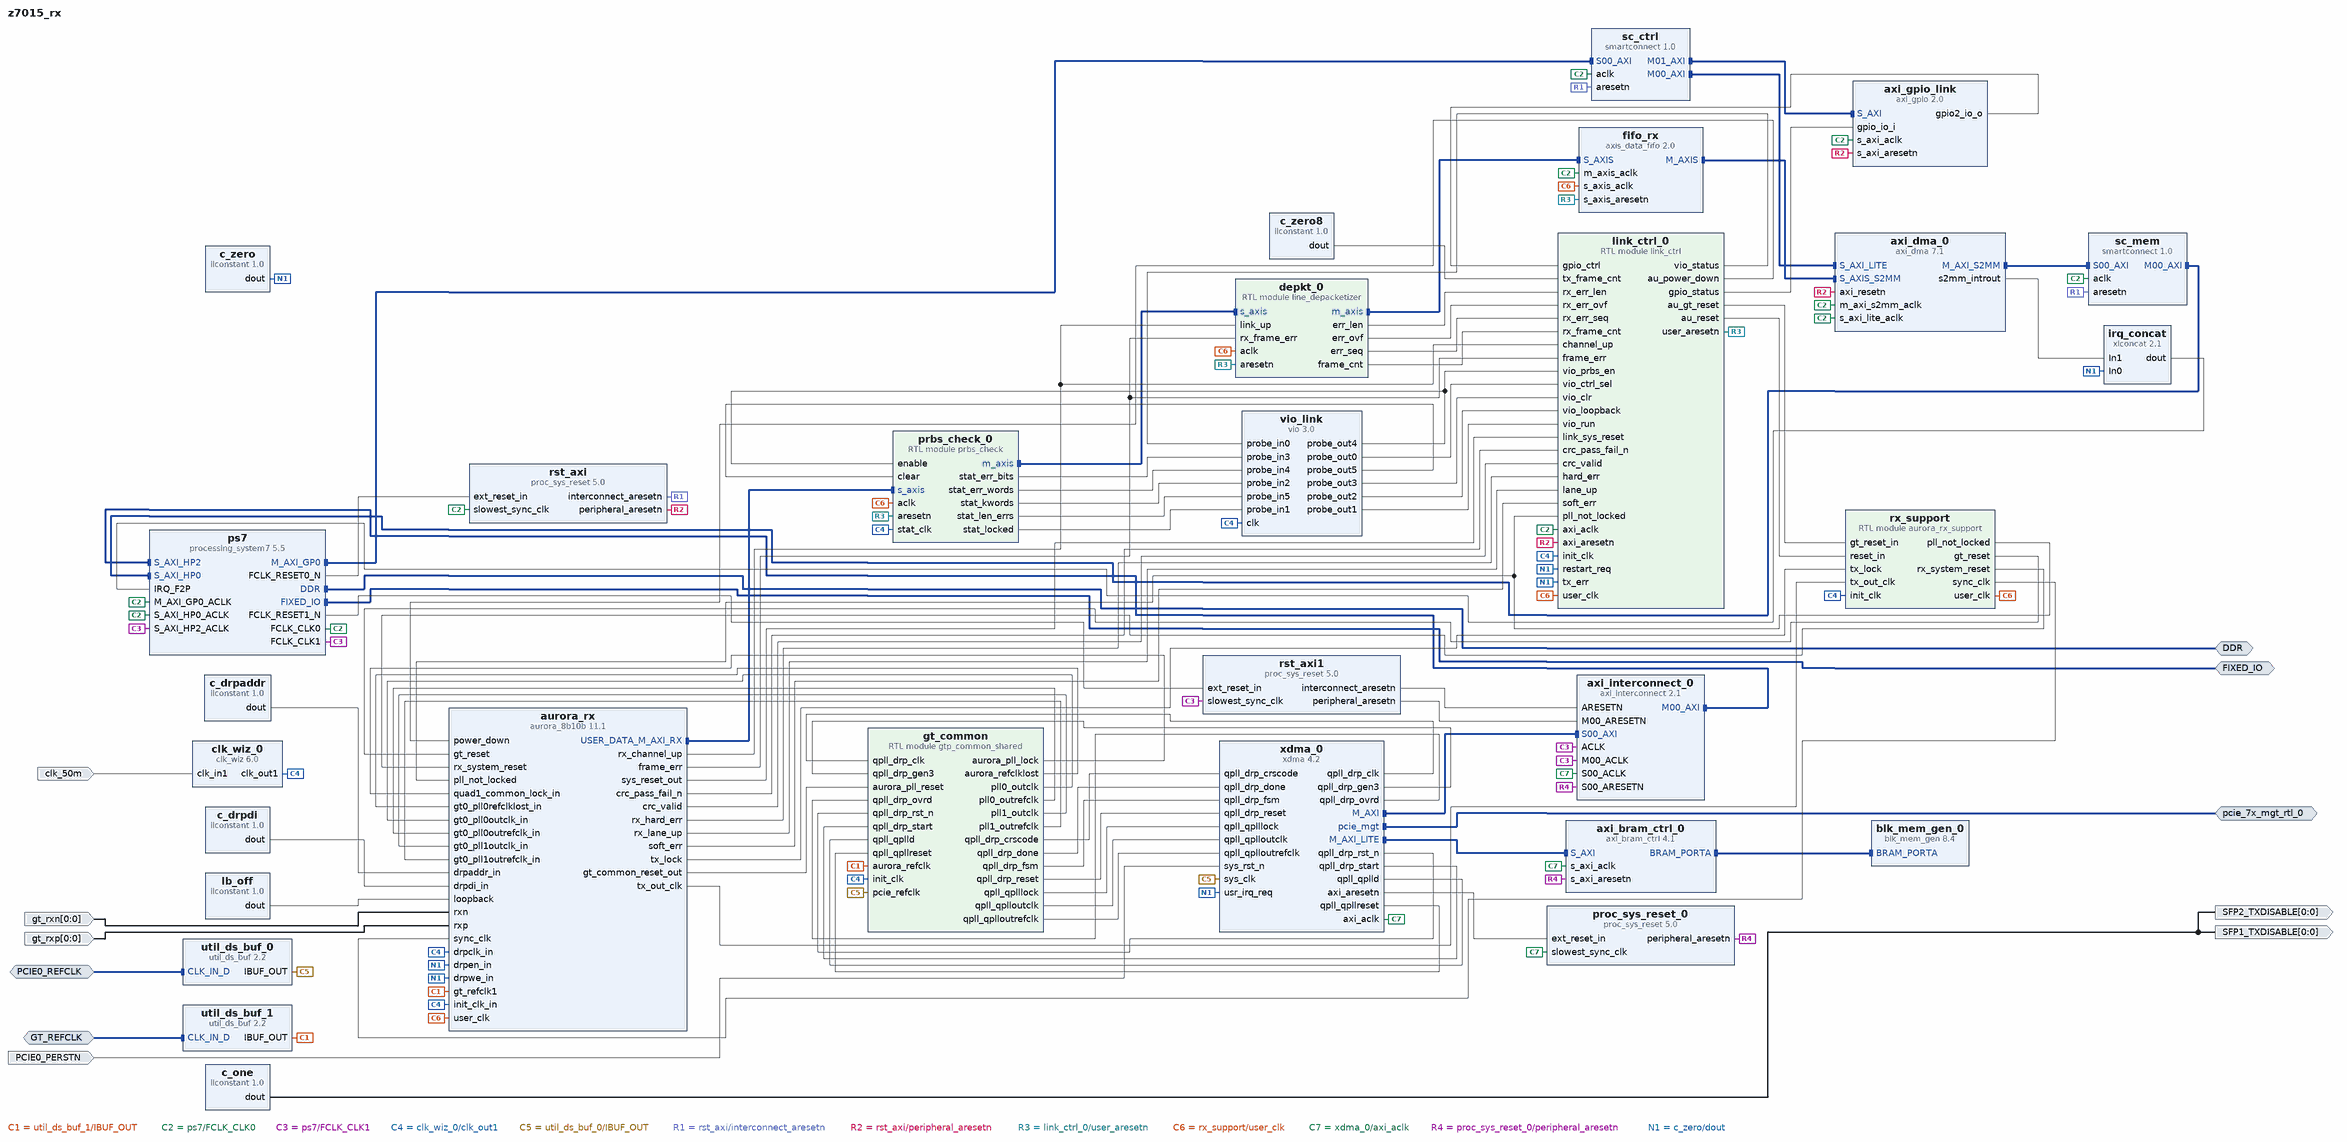
[diagram p0: block diagram of the top level]
# Vivado block design z7015_rx, xc7z015clg485-2, Vivado 2025.2
create_bd_design z7015_rx

create_bd_intf_port -mode Master -vlnv xilinx.com:interface:ddrx_rtl:1.0 DDR
create_bd_intf_port -mode Master -vlnv xilinx.com:display_processing_system7:fixedio_rtl:1.0 FIXED_IO
create_bd_intf_port -mode Slave -vlnv xilinx.com:interface:diff_clock_rtl:1.0 PCIE0_REFCLK
set_property -dict {CONFIG.FREQ_HZ 100000000} [get_bd_intf_ports PCIE0_REFCLK]
create_bd_intf_port -mode Slave -vlnv xilinx.com:interface:diff_clock_rtl:1.0 GT_REFCLK
set_property -dict {CONFIG.FREQ_HZ 125000000} [get_bd_intf_ports GT_REFCLK]
create_bd_intf_port -mode Master -vlnv xilinx.com:interface:pcie_7x_mgt_rtl:1.0 pcie_7x_mgt_rtl_0
create_bd_port -dir I -from 0 -to 0 gt_rxp
create_bd_port -dir I -from 0 -to 0 gt_rxn
create_bd_port -dir I -type clk clk_50m
set_property -dict {CONFIG.FREQ_HZ 50000000} [get_bd_ports clk_50m]
create_bd_port -dir O -from 0 -to 0 SFP1_TXDISABLE
create_bd_port -dir O -from 0 -to 0 SFP2_TXDISABLE
create_bd_port -dir I PCIE0_PERSTN

create_bd_cell -type ip -vlnv xilinx.com:ip:processing_system7:5.5 ps7
set_property -dict [list \
  CONFIG.PCW_APU_PERIPHERAL_FREQMHZ 766.666666 \
  CONFIG.PCW_CPU_CPU_6X4X_MAX_RANGE 767 \
  CONFIG.PCW_ENET0_ENET0_IO {MIO 16 .. 27} \
  CONFIG.PCW_ENET0_GRP_MDIO_ENABLE 1 \
  CONFIG.PCW_ENET0_GRP_MDIO_IO {MIO 52 .. 53} \
  CONFIG.PCW_ENET0_PERIPHERAL_ENABLE 1 \
  CONFIG.PCW_ENET0_RESET_ENABLE 1 \
  CONFIG.PCW_ENET0_RESET_IO {MIO 7} \
  CONFIG.PCW_ENET_RESET_ENABLE 1 \
  CONFIG.PCW_ENET_RESET_SELECT {Share reset pin} \
  CONFIG.PCW_EN_CLK1_PORT 1 \
  CONFIG.PCW_EN_RST1_PORT 1 \
  CONFIG.PCW_FCLK_CLK1_BUF TRUE \
  CONFIG.PCW_FPGA0_PERIPHERAL_FREQMHZ 100 \
  CONFIG.PCW_FPGA1_PERIPHERAL_FREQMHZ 140 \
  CONFIG.PCW_FPGA_FCLK1_ENABLE 1 \
  CONFIG.PCW_GPIO_MIO_GPIO_ENABLE 1 \
  CONFIG.PCW_GPIO_MIO_GPIO_IO MIO \
  CONFIG.PCW_I2C_RESET_ENABLE 0 \
  CONFIG.PCW_IRQ_F2P_INTR 1 \
  CONFIG.PCW_PERIPHERAL_BOARD_PRESET None \
  CONFIG.PCW_PRESET_BANK1_VOLTAGE {LVCMOS 1.8V} \
  CONFIG.PCW_QSPI_GRP_SINGLE_SS_ENABLE 1 \
  CONFIG.PCW_QSPI_GRP_SINGLE_SS_IO {MIO 1 .. 6} \
  CONFIG.PCW_QSPI_PERIPHERAL_ENABLE 1 \
  CONFIG.PCW_QSPI_QSPI_IO {MIO 1 .. 6} \
  CONFIG.PCW_SD0_GRP_CD_ENABLE 0 \
  CONFIG.PCW_SD0_GRP_WP_ENABLE 0 \
  CONFIG.PCW_SD0_PERIPHERAL_ENABLE 1 \
  CONFIG.PCW_SD0_SD0_IO {MIO 40 .. 45} \
  CONFIG.PCW_SDIO_PERIPHERAL_FREQMHZ 100 \
  CONFIG.PCW_SINGLE_QSPI_DATA_MODE x4 \
  CONFIG.PCW_UART0_PERIPHERAL_ENABLE 1 \
  CONFIG.PCW_UART0_UART0_IO {MIO 14 .. 15} \
  CONFIG.PCW_UART1_PERIPHERAL_ENABLE 0 \
  CONFIG.PCW_UART_PERIPHERAL_FREQMHZ 100 \
  CONFIG.PCW_UIPARAM_DDR_FREQ_MHZ 533.333333 \
  CONFIG.PCW_UIPARAM_DDR_MEMORY_TYPE {DDR 3 (Low Voltage)} \
  CONFIG.PCW_UIPARAM_DDR_PARTNO Custom \
  CONFIG.PCW_USB0_PERIPHERAL_ENABLE 1 \
  CONFIG.PCW_USB0_RESET_ENABLE 1 \
  CONFIG.PCW_USB0_RESET_IO {MIO 8} \
  CONFIG.PCW_USB0_USB0_IO {MIO 28 .. 39} \
  CONFIG.PCW_USB_RESET_ENABLE 1 \
  CONFIG.PCW_USB_RESET_SELECT {Share reset pin} \
  CONFIG.PCW_USE_FABRIC_INTERRUPT 1 \
  CONFIG.PCW_USE_S_AXI_HP0 1 \
  CONFIG.PCW_USE_S_AXI_HP2 1 \
] [get_bd_cells ps7]
# 521 more settings of ps7 are not shown: defaults, MIO pin electricals, DDR timing, and values the tool derives
create_bd_cell -type ip -vlnv xilinx.com:ip:proc_sys_reset:5.0 rst_axi
create_bd_cell -type ip -vlnv xilinx.com:ip:proc_sys_reset:5.0 rst_axi1
create_bd_cell -type ip -vlnv xilinx.com:ip:axi_dma:7.1 axi_dma_0
set_property -dict [list \
  CONFIG.c_addr_width 32 \
  CONFIG.c_include_mm2s 0 \
  CONFIG.c_include_s2mm 1 \
  CONFIG.c_include_sg 0 \
  CONFIG.c_m_axi_s2mm_data_width 64 \
  CONFIG.c_s2mm_burst_size 64 \
  CONFIG.c_s_axis_s2mm_tdata_width 32 \
  CONFIG.c_sg_length_width 24 \
] [get_bd_cells axi_dma_0]
create_bd_cell -type ip -vlnv xilinx.com:ip:axi_gpio:2.0 axi_gpio_link
set_property -dict [list \
  CONFIG.C_ALL_INPUTS 1 \
  CONFIG.C_ALL_OUTPUTS_2 1 \
  CONFIG.C_DOUT_DEFAULT_2 0x00000001 \
  CONFIG.C_GPIO2_WIDTH 32 \
  CONFIG.C_GPIO_WIDTH 32 \
  CONFIG.C_IS_DUAL 1 \
] [get_bd_cells axi_gpio_link]
create_bd_cell -type ip -vlnv xilinx.com:ip:smartconnect:1.0 sc_ctrl
set_property -dict {CONFIG.NUM_MI 2 CONFIG.NUM_SI 1} [get_bd_cells sc_ctrl]
create_bd_cell -type ip -vlnv xilinx.com:ip:smartconnect:1.0 sc_mem
set_property -dict {CONFIG.NUM_MI 1 CONFIG.NUM_SI 1} [get_bd_cells sc_mem]
create_bd_cell -type ip -vlnv xilinx.com:ip:xlconcat:2.1 irq_concat
set_property -dict {CONFIG.NUM_PORTS 2} [get_bd_cells irq_concat]
create_bd_cell -type ip -vlnv xilinx.com:ip:axis_data_fifo:2.0 fifo_rx
set_property -dict {CONFIG.FIFO_DEPTH 4096 CONFIG.IS_ACLK_ASYNC 1} [get_bd_cells fifo_rx]
create_bd_cell -type module -reference line_depacketizer depkt_0
set_property -dict {CONFIG.H_BEATS 640 CONFIG.TLAST_PER_LINE 0 CONFIG.V_LINES 720} [get_bd_cells depkt_0]
create_bd_cell -type module -reference prbs_check prbs_check_0
set_property -dict {CONFIG.FRAME_WORDS 256} [get_bd_cells prbs_check_0]
create_bd_cell -type module -reference link_ctrl link_ctrl_0
set_property -dict {CONFIG.EMULATED 0 CONFIG.RETRY_TMO 0} [get_bd_cells link_ctrl_0]
create_bd_cell -type ip -vlnv xilinx.com:ip:vio:3.0 vio_link
set_property -dict [list \
  CONFIG.C_EN_PROBE_IN_ACTIVITY 0 \
  CONFIG.C_NUM_PROBE_IN 6 \
  CONFIG.C_NUM_PROBE_OUT 6 \
  CONFIG.C_PROBE_IN0_WIDTH 32 \
  CONFIG.C_PROBE_IN1_WIDTH 1 \
  CONFIG.C_PROBE_IN2_WIDTH 32 \
  CONFIG.C_PROBE_IN3_WIDTH 32 \
  CONFIG.C_PROBE_IN4_WIDTH 32 \
  CONFIG.C_PROBE_IN5_WIDTH 16 \
  CONFIG.C_PROBE_OUT0_INIT_VAL 0x1 \
  CONFIG.C_PROBE_OUT0_WIDTH 1 \
  CONFIG.C_PROBE_OUT1_INIT_VAL 0x1 \
  CONFIG.C_PROBE_OUT1_WIDTH 1 \
  CONFIG.C_PROBE_OUT2_INIT_VAL 0x0 \
  CONFIG.C_PROBE_OUT2_WIDTH 3 \
  CONFIG.C_PROBE_OUT3_INIT_VAL 0x0 \
  CONFIG.C_PROBE_OUT3_WIDTH 1 \
  CONFIG.C_PROBE_OUT4_INIT_VAL 0x0 \
  CONFIG.C_PROBE_OUT4_WIDTH 1 \
  CONFIG.C_PROBE_OUT5_INIT_VAL 0x0 \
  CONFIG.C_PROBE_OUT5_WIDTH 1 \
] [get_bd_cells vio_link]
create_bd_cell -type ip -vlnv xilinx.com:ip:aurora_8b10b:11.1 aurora_rx
set_property -dict [list \
  CONFIG.Backchannel_mode Timer \
  CONFIG.C_AURORA_LANES 1 \
  CONFIG.C_DRP_IF true \
  CONFIG.C_GT_CLOCK_1 GTPQ0 \
  CONFIG.C_GT_LOC_1 X \
  CONFIG.C_GT_LOC_2 1 \
  CONFIG.C_GT_LOC_3 X \
  CONFIG.C_GT_LOC_4 X \
  CONFIG.C_LANE_WIDTH 4 \
  CONFIG.C_LINE_RATE 3.125 \
  CONFIG.C_REFCLK_FREQUENCY 125.000 \
  CONFIG.C_USE_BYTESWAP true \
  CONFIG.C_USE_CRC true \
  CONFIG.C_USE_SCRAMBLER false \
  CONFIG.DRP_FREQ 62.5 \
  CONFIG.Dataflow_Config RX-only_Simplex \
  CONFIG.Flow_Mode None \
  CONFIG.Interface_Mode Framing \
  CONFIG.SupportLevel 0 \
  CONFIG.TransceiverControl false \
] [get_bd_cells aurora_rx]
create_bd_cell -type module -reference aurora_rx_support rx_support
create_bd_cell -type module -reference gtp_common_shared gt_common
create_bd_cell -type ip -vlnv xilinx.com:ip:clk_wiz:6.0 clk_wiz_0
set_property -dict [list \
  CONFIG.CLKOUT1_DRIVES BUFG \
  CONFIG.CLKOUT1_JITTER 181.275 \
  CONFIG.CLKOUT1_REQUESTED_OUT_FREQ 62.5 \
  CONFIG.MMCM_CLKOUT0_DIVIDE_F 16.000 \
  CONFIG.SECONDARY_SOURCE Single_ended_clock_capable_pin \
  CONFIG.USE_LOCKED false \
  CONFIG.USE_PHASE_ALIGNMENT false \
  CONFIG.USE_RESET false \
] [get_bd_cells clk_wiz_0]
create_bd_cell -type ip -vlnv xilinx.com:ip:util_ds_buf:2.2 util_ds_buf_0
set_property -dict {CONFIG.C_BUF_TYPE IBUFDSGTE} [get_bd_cells util_ds_buf_0]
create_bd_cell -type ip -vlnv xilinx.com:ip:util_ds_buf:2.2 util_ds_buf_1
set_property -dict {CONFIG.C_BUF_TYPE IBUFDSGTE} [get_bd_cells util_ds_buf_1]
create_bd_cell -type ip -vlnv xilinx.com:ip:xdma:4.2 xdma_0
set_property -dict [list \
  CONFIG.Shared_Logic_Gtc_7xG2 true \
  CONFIG.axilite_master_en true \
  CONFIG.axilite_master_scale Kilobytes \
  CONFIG.axilite_master_size 4 \
  CONFIG.axisten_freq 125 \
  CONFIG.mode_selection Advanced \
  CONFIG.pf0_interrupt_pin NONE \
  CONFIG.pf0_msi_enabled false \
  CONFIG.pf0_msix_enabled true \
  CONFIG.xdma_axi_intf_mm AXI_Memory_Mapped \
] [get_bd_cells xdma_0]
create_bd_cell -type ip -vlnv xilinx.com:ip:axi_interconnect:2.1 axi_interconnect_0
set_property -dict {CONFIG.NUM_MI 1 CONFIG.S00_HAS_DATA_FIFO 2} [get_bd_cells axi_interconnect_0]
create_bd_cell -type ip -vlnv xilinx.com:ip:axi_bram_ctrl:4.1 axi_bram_ctrl_0
set_property -dict {CONFIG.PROTOCOL AXI4LITE CONFIG.SINGLE_PORT_BRAM 1} [get_bd_cells axi_bram_ctrl_0]
create_bd_cell -type ip -vlnv xilinx.com:ip:blk_mem_gen:8.4 blk_mem_gen_0
create_bd_cell -type ip -vlnv xilinx.com:ip:proc_sys_reset:5.0 proc_sys_reset_0
create_bd_cell -type inline_hdl -vlnv xilinx.com:inline_hdl:ilconstant:1.0 c_zero
set_property -dict {CONFIG.CONST_VAL 0 CONFIG.CONST_WIDTH 1} [get_bd_cells c_zero]
create_bd_cell -type inline_hdl -vlnv xilinx.com:inline_hdl:ilconstant:1.0 c_one
set_property -dict {CONFIG.CONST_VAL 1 CONFIG.CONST_WIDTH 1} [get_bd_cells c_one]
create_bd_cell -type inline_hdl -vlnv xilinx.com:inline_hdl:ilconstant:1.0 c_zero8
set_property -dict {CONFIG.CONST_VAL 0 CONFIG.CONST_WIDTH 8} [get_bd_cells c_zero8]
create_bd_cell -type inline_hdl -vlnv xilinx.com:inline_hdl:ilconstant:1.0 lb_off
set_property -dict {CONFIG.CONST_VAL 0 CONFIG.CONST_WIDTH 3} [get_bd_cells lb_off]
create_bd_cell -type inline_hdl -vlnv xilinx.com:inline_hdl:ilconstant:1.0 c_drpaddr
set_property -dict {CONFIG.CONST_VAL 0 CONFIG.CONST_WIDTH 9} [get_bd_cells c_drpaddr]
create_bd_cell -type inline_hdl -vlnv xilinx.com:inline_hdl:ilconstant:1.0 c_drpdi
set_property -dict {CONFIG.CONST_VAL 0 CONFIG.CONST_WIDTH 16} [get_bd_cells c_drpdi]

# ---- connections ----

connect_bd_intf_net [get_bd_intf_ports GT_REFCLK] [get_bd_intf_pins util_ds_buf_1/CLK_IN_D]
connect_bd_intf_net [get_bd_intf_ports PCIE0_REFCLK] [get_bd_intf_pins util_ds_buf_0/CLK_IN_D]
connect_bd_intf_net -intf_net aurora_rx_data [get_bd_intf_pins aurora_rx/USER_DATA_M_AXI_RX] [get_bd_intf_pins prbs_check_0/s_axis]
connect_bd_intf_net -intf_net axi_ic_M00 [get_bd_intf_pins axi_interconnect_0/M00_AXI] [get_bd_intf_pins ps7/S_AXI_HP2]
connect_bd_intf_net [get_bd_intf_pins axi_bram_ctrl_0/BRAM_PORTA] [get_bd_intf_pins blk_mem_gen_0/BRAM_PORTA]
connect_bd_intf_net -intf_net depkt_m [get_bd_intf_pins depkt_0/m_axis] [get_bd_intf_pins fifo_rx/S_AXIS]
connect_bd_intf_net -intf_net dma_s2mm [get_bd_intf_pins axi_dma_0/M_AXI_S2MM] [get_bd_intf_pins sc_mem/S00_AXI]
connect_bd_intf_net -intf_net fifo_rx_m [get_bd_intf_pins fifo_rx/M_AXIS] [get_bd_intf_pins axi_dma_0/S_AXIS_S2MM]
connect_bd_intf_net -intf_net prbs_check_m [get_bd_intf_pins prbs_check_0/m_axis] [get_bd_intf_pins depkt_0/s_axis]
connect_bd_intf_net [get_bd_intf_pins ps7/DDR] [get_bd_intf_ports DDR]
connect_bd_intf_net [get_bd_intf_pins ps7/FIXED_IO] [get_bd_intf_ports FIXED_IO]
connect_bd_intf_net [get_bd_intf_pins ps7/M_AXI_GP0] [get_bd_intf_pins sc_ctrl/S00_AXI]
connect_bd_intf_net -intf_net sc_ctrl_M00 [get_bd_intf_pins sc_ctrl/M00_AXI] [get_bd_intf_pins axi_dma_0/S_AXI_LITE]
connect_bd_intf_net -intf_net sc_ctrl_M01 [get_bd_intf_pins sc_ctrl/M01_AXI] [get_bd_intf_pins axi_gpio_link/S_AXI]
connect_bd_intf_net -intf_net sc_mem_M00 [get_bd_intf_pins sc_mem/M00_AXI] [get_bd_intf_pins ps7/S_AXI_HP0]
connect_bd_intf_net -intf_net xdma_M_AXI [get_bd_intf_pins xdma_0/M_AXI] [get_bd_intf_pins axi_interconnect_0/S00_AXI]
connect_bd_intf_net -intf_net xdma_M_AXI_LITE [get_bd_intf_pins xdma_0/M_AXI_LITE] [get_bd_intf_pins axi_bram_ctrl_0/S_AXI]
connect_bd_intf_net -intf_net xdma_pcie_mgt [get_bd_intf_pins xdma_0/pcie_mgt] [get_bd_intf_ports pcie_7x_mgt_rtl_0]
connect_bd_net [get_bd_ports PCIE0_PERSTN] [get_bd_pins xdma_0/sys_rst_n]
connect_bd_net -net au_gt_common_reset [get_bd_pins aurora_rx/gt_common_reset_out] [get_bd_pins gt_common/aurora_pll_reset]
connect_bd_net -net au_gt_reset_deb [get_bd_pins rx_support/gt_reset] [get_bd_pins aurora_rx/gt_reset]
connect_bd_net -net au_pll1_lock [get_bd_pins gt_common/aurora_pll_lock] [get_bd_pins aurora_rx/quad1_common_lock_in]
connect_bd_net -net au_pll1_refclklost [get_bd_pins gt_common/aurora_refclklost] [get_bd_pins aurora_rx/gt0_pll0refclklost_in]
connect_bd_net -net au_rx_system_reset [get_bd_pins rx_support/rx_system_reset] [get_bd_pins aurora_rx/rx_system_reset]
connect_bd_net -net au_sys_reset_out [get_bd_pins aurora_rx/sys_reset_out] [get_bd_pins link_ctrl_0/link_sys_reset]
connect_bd_net -net au_tx_lock [get_bd_pins aurora_rx/tx_lock] [get_bd_pins rx_support/tx_lock]
connect_bd_net -net au_tx_out_clk [get_bd_pins aurora_rx/tx_out_clk] [get_bd_pins rx_support/tx_out_clk]
connect_bd_net -net aurora_refclk [get_bd_pins util_ds_buf_1/IBUF_OUT] [get_bd_pins gt_common/aurora_refclk] [get_bd_pins aurora_rx/gt_refclk1]
connect_bd_net [get_bd_ports clk_50m] [get_bd_pins clk_wiz_0/clk_in1]
connect_bd_net -net depkt_err_len [get_bd_pins depkt_0/err_len] [get_bd_pins link_ctrl_0/rx_err_len]
connect_bd_net -net depkt_err_ovf [get_bd_pins depkt_0/err_ovf] [get_bd_pins link_ctrl_0/rx_err_ovf]
connect_bd_net -net depkt_err_seq [get_bd_pins depkt_0/err_seq] [get_bd_pins link_ctrl_0/rx_err_seq]
connect_bd_net -net depkt_frame_cnt [get_bd_pins depkt_0/frame_cnt] [get_bd_pins link_ctrl_0/rx_frame_cnt]
connect_bd_net -net drpaddr_zero [get_bd_pins c_drpaddr/dout] [get_bd_pins aurora_rx/drpaddr_in]
connect_bd_net -net drpdi_zero [get_bd_pins c_drpdi/dout] [get_bd_pins aurora_rx/drpdi_in]
connect_bd_net -net fclk0 [get_bd_pins ps7/FCLK_CLK0] \
  [get_bd_pins ps7/M_AXI_GP0_ACLK] [get_bd_pins ps7/S_AXI_HP0_ACLK] [get_bd_pins rst_axi/slowest_sync_clk] \
  [get_bd_pins axi_dma_0/m_axi_s2mm_aclk] [get_bd_pins axi_dma_0/s_axi_lite_aclk] [get_bd_pins axi_gpio_link/s_axi_aclk] \
  [get_bd_pins sc_ctrl/aclk] [get_bd_pins sc_mem/aclk] [get_bd_pins fifo_rx/m_axis_aclk] [get_bd_pins link_ctrl_0/axi_aclk]
connect_bd_net -net fclk1 [get_bd_pins ps7/FCLK_CLK1] \
  [get_bd_pins ps7/S_AXI_HP2_ACLK] [get_bd_pins rst_axi1/slowest_sync_clk] [get_bd_pins axi_interconnect_0/ACLK] \
  [get_bd_pins axi_interconnect_0/M00_ACLK]
connect_bd_net -net fclk_reset0_n [get_bd_pins ps7/FCLK_RESET0_N] [get_bd_pins rst_axi/ext_reset_in]
connect_bd_net -net fclk_reset1_n [get_bd_pins ps7/FCLK_RESET1_N] [get_bd_pins rst_axi1/ext_reset_in]
connect_bd_net -net gpio_ctrl [get_bd_pins axi_gpio_link/gpio2_io_o] [get_bd_pins link_ctrl_0/gpio_ctrl]
connect_bd_net -net gpio_status [get_bd_pins link_ctrl_0/gpio_status] [get_bd_pins axi_gpio_link/gpio_io_i]
connect_bd_net [get_bd_ports gt_rxn] [get_bd_pins aurora_rx/rxn]
connect_bd_net [get_bd_ports gt_rxp] [get_bd_pins aurora_rx/rxp]
connect_bd_net -net gtc_pll0_outclk [get_bd_pins gt_common/pll0_outclk] [get_bd_pins aurora_rx/gt0_pll0outclk_in]
connect_bd_net -net gtc_pll0_outrefclk [get_bd_pins gt_common/pll0_outrefclk] [get_bd_pins aurora_rx/gt0_pll0outrefclk_in]
connect_bd_net -net gtc_pll1_outclk [get_bd_pins gt_common/pll1_outclk] [get_bd_pins aurora_rx/gt0_pll1outclk_in]
connect_bd_net -net gtc_pll1_outrefclk [get_bd_pins gt_common/pll1_outrefclk] [get_bd_pins aurora_rx/gt0_pll1outrefclk_in]
connect_bd_net -net gtc_qpll_drp_crscode [get_bd_pins gt_common/qpll_drp_crscode] [get_bd_pins xdma_0/qpll_drp_crscode]
connect_bd_net -net gtc_qpll_drp_done [get_bd_pins gt_common/qpll_drp_done] [get_bd_pins xdma_0/qpll_drp_done]
connect_bd_net -net gtc_qpll_drp_fsm [get_bd_pins gt_common/qpll_drp_fsm] [get_bd_pins xdma_0/qpll_drp_fsm]
connect_bd_net -net gtc_qpll_drp_reset [get_bd_pins gt_common/qpll_drp_reset] [get_bd_pins xdma_0/qpll_drp_reset]
connect_bd_net -net gtc_qpll_qplllock [get_bd_pins gt_common/qpll_qplllock] [get_bd_pins xdma_0/qpll_qplllock]
connect_bd_net -net gtc_qpll_qplloutclk [get_bd_pins gt_common/qpll_qplloutclk] [get_bd_pins xdma_0/qpll_qplloutclk]
connect_bd_net -net gtc_qpll_qplloutrefclk [get_bd_pins gt_common/qpll_qplloutrefclk] [get_bd_pins xdma_0/qpll_qplloutrefclk]
connect_bd_net -net init_clk [get_bd_pins clk_wiz_0/clk_out1] \
  [get_bd_pins gt_common/init_clk] [get_bd_pins rx_support/init_clk] [get_bd_pins aurora_rx/init_clk_in] \
  [get_bd_pins aurora_rx/drpclk_in] [get_bd_pins link_ctrl_0/init_clk] [get_bd_pins vio_link/clk] \
  [get_bd_pins prbs_check_0/stat_clk]
connect_bd_net -net irq_f2p [get_bd_pins irq_concat/dout] [get_bd_pins ps7/IRQ_F2P]
connect_bd_net [get_bd_pins lb_off/dout] [get_bd_pins aurora_rx/loopback]
connect_bd_net -net link_ctrl_au_gt_reset [get_bd_pins link_ctrl_0/au_gt_reset] [get_bd_pins rx_support/gt_reset_in]
connect_bd_net -net link_ctrl_au_power_down [get_bd_pins link_ctrl_0/au_power_down] [get_bd_pins aurora_rx/power_down]
connect_bd_net -net link_ctrl_au_reset [get_bd_pins link_ctrl_0/au_reset] [get_bd_pins rx_support/reset_in]
connect_bd_net -net link_status [get_bd_pins link_ctrl_0/vio_status] [get_bd_pins vio_link/probe_in0]
connect_bd_net -net one [get_bd_pins c_one/dout] [get_bd_ports SFP1_TXDISABLE] [get_bd_ports SFP2_TXDISABLE]
connect_bd_net -net pcie_refclk [get_bd_pins util_ds_buf_0/IBUF_OUT] [get_bd_pins xdma_0/sys_clk] [get_bd_pins gt_common/pcie_refclk]
connect_bd_net -net pll_not_locked [get_bd_pins rx_support/pll_not_locked] \
  [get_bd_pins aurora_rx/pll_not_locked] [get_bd_pins link_ctrl_0/pll_not_locked]
connect_bd_net -net prbs_err_bits [get_bd_pins prbs_check_0/stat_err_bits] [get_bd_pins vio_link/probe_in3]
connect_bd_net -net prbs_err_words [get_bd_pins prbs_check_0/stat_err_words] [get_bd_pins vio_link/probe_in4]
connect_bd_net -net prbs_kwords [get_bd_pins prbs_check_0/stat_kwords] [get_bd_pins vio_link/probe_in2]
connect_bd_net -net prbs_len_errs [get_bd_pins prbs_check_0/stat_len_errs] [get_bd_pins vio_link/probe_in5]
connect_bd_net -net prbs_locked [get_bd_pins prbs_check_0/stat_locked] [get_bd_pins vio_link/probe_in1]
connect_bd_net -net rst_axi1_ic_aresetn [get_bd_pins rst_axi1/interconnect_aresetn] [get_bd_pins axi_interconnect_0/ARESETN]
connect_bd_net -net rst_axi1_periph_aresetn [get_bd_pins rst_axi1/peripheral_aresetn] [get_bd_pins axi_interconnect_0/M00_ARESETN]
connect_bd_net -net rst_axi_ic_aresetn [get_bd_pins rst_axi/interconnect_aresetn] [get_bd_pins sc_ctrl/aresetn] [get_bd_pins sc_mem/aresetn]
connect_bd_net -net rst_axi_periph_aresetn [get_bd_pins rst_axi/peripheral_aresetn] \
  [get_bd_pins axi_dma_0/axi_resetn] [get_bd_pins axi_gpio_link/s_axi_aresetn] [get_bd_pins link_ctrl_0/axi_aresetn]
connect_bd_net -net rx_channel_up [get_bd_pins aurora_rx/rx_channel_up] [get_bd_pins link_ctrl_0/channel_up] [get_bd_pins depkt_0/link_up]
connect_bd_net -net rx_crc_pass_fail_n [get_bd_pins aurora_rx/crc_pass_fail_n] [get_bd_pins link_ctrl_0/crc_pass_fail_n]
connect_bd_net -net rx_crc_valid [get_bd_pins aurora_rx/crc_valid] [get_bd_pins link_ctrl_0/crc_valid]
connect_bd_net -net rx_frame_err [get_bd_pins aurora_rx/frame_err] [get_bd_pins link_ctrl_0/frame_err] [get_bd_pins depkt_0/rx_frame_err]
connect_bd_net -net rx_hard_err [get_bd_pins aurora_rx/rx_hard_err] [get_bd_pins link_ctrl_0/hard_err]
connect_bd_net -net rx_lane_up [get_bd_pins aurora_rx/rx_lane_up] [get_bd_pins link_ctrl_0/lane_up]
connect_bd_net -net rx_soft_err [get_bd_pins aurora_rx/soft_err] [get_bd_pins link_ctrl_0/soft_err]
connect_bd_net -net s2mm_introut [get_bd_pins axi_dma_0/s2mm_introut] [get_bd_pins irq_concat/In1]
connect_bd_net -net sync_clk [get_bd_pins rx_support/sync_clk] [get_bd_pins aurora_rx/sync_clk]
connect_bd_net -net tx_frames_zero [get_bd_pins c_zero8/dout] [get_bd_pins link_ctrl_0/tx_frame_cnt]
connect_bd_net -net user_aresetn [get_bd_pins link_ctrl_0/user_aresetn] \
  [get_bd_pins depkt_0/aresetn] [get_bd_pins prbs_check_0/aresetn] [get_bd_pins fifo_rx/s_axis_aresetn]
connect_bd_net -net user_clk [get_bd_pins rx_support/user_clk] \
  [get_bd_pins aurora_rx/user_clk] [get_bd_pins depkt_0/aclk] [get_bd_pins prbs_check_0/aclk] \
  [get_bd_pins fifo_rx/s_axis_aclk] [get_bd_pins link_ctrl_0/user_clk]
connect_bd_net -net vio_ctrl_sel [get_bd_pins vio_link/probe_out0] [get_bd_pins link_ctrl_0/vio_ctrl_sel]
connect_bd_net -net vio_err_clear [get_bd_pins vio_link/probe_out3] [get_bd_pins link_ctrl_0/vio_clr]
connect_bd_net -net vio_loopback [get_bd_pins vio_link/probe_out2] [get_bd_pins link_ctrl_0/vio_loopback]
connect_bd_net -net vio_prbs_clear [get_bd_pins vio_link/probe_out5] [get_bd_pins prbs_check_0/clear]
connect_bd_net -net vio_prbs_en [get_bd_pins vio_link/probe_out4] [get_bd_pins prbs_check_0/enable] [get_bd_pins link_ctrl_0/vio_prbs_en]
connect_bd_net -net vio_run [get_bd_pins vio_link/probe_out1] [get_bd_pins link_ctrl_0/vio_run]
connect_bd_net -net xdma_axi_aclk [get_bd_pins xdma_0/axi_aclk] \
  [get_bd_pins proc_sys_reset_0/slowest_sync_clk] [get_bd_pins axi_bram_ctrl_0/s_axi_aclk] \
  [get_bd_pins axi_interconnect_0/S00_ACLK]
connect_bd_net -net xdma_axi_aresetn [get_bd_pins xdma_0/axi_aresetn] [get_bd_pins proc_sys_reset_0/ext_reset_in]
connect_bd_net -net xdma_periph_aresetn [get_bd_pins proc_sys_reset_0/peripheral_aresetn] \
  [get_bd_pins axi_bram_ctrl_0/s_axi_aresetn] [get_bd_pins axi_interconnect_0/S00_ARESETN]
connect_bd_net -net xdma_qpll_drp_clk [get_bd_pins xdma_0/qpll_drp_clk] [get_bd_pins gt_common/qpll_drp_clk]
connect_bd_net -net xdma_qpll_drp_gen3 [get_bd_pins xdma_0/qpll_drp_gen3] [get_bd_pins gt_common/qpll_drp_gen3]
connect_bd_net -net xdma_qpll_drp_ovrd [get_bd_pins xdma_0/qpll_drp_ovrd] [get_bd_pins gt_common/qpll_drp_ovrd]
connect_bd_net -net xdma_qpll_drp_rst_n [get_bd_pins xdma_0/qpll_drp_rst_n] [get_bd_pins gt_common/qpll_drp_rst_n]
connect_bd_net -net xdma_qpll_drp_start [get_bd_pins xdma_0/qpll_drp_start] [get_bd_pins gt_common/qpll_drp_start]
connect_bd_net -net xdma_qpll_qplld [get_bd_pins xdma_0/qpll_qplld] [get_bd_pins gt_common/qpll_qplld]
connect_bd_net -net xdma_qpll_qpllreset [get_bd_pins xdma_0/qpll_qpllreset] [get_bd_pins gt_common/qpll_qpllreset]
connect_bd_net -net zero [get_bd_pins c_zero/dout] \
  [get_bd_pins aurora_rx/drpen_in] [get_bd_pins aurora_rx/drpwe_in] [get_bd_pins link_ctrl_0/tx_err] \
  [get_bd_pins link_ctrl_0/restart_req] [get_bd_pins xdma_0/usr_irq_req] [get_bd_pins irq_concat/In0]

# ---- address map ----
assign_bd_address -offset 0x00000000 -range 1G -target_address_space [get_bd_addr_spaces axi_dma_0/Data_S2MM] [get_bd_addr_segs ps7/S_AXI_HP0/HP0_DDR_LOWOCM]
assign_bd_address -offset 0x40400000 -range 64K -target_address_space [get_bd_addr_spaces ps7/Data] [get_bd_addr_segs axi_dma_0/S_AXI_LITE/Reg]
assign_bd_address -offset 0x41200000 -range 64K -target_address_space [get_bd_addr_spaces ps7/Data] [get_bd_addr_segs axi_gpio_link/S_AXI/Reg]
assign_bd_address -offset 0x0000000000000000 -range 1G -target_address_space [get_bd_addr_spaces xdma_0/M_AXI] [get_bd_addr_segs ps7/S_AXI_HP2/HP2_DDR_LOWOCM]
assign_bd_address -offset 0xC0000000 -range 4K -target_address_space [get_bd_addr_spaces xdma_0/M_AXI_LITE] [get_bd_addr_segs axi_bram_ctrl_0/S_AXI/Mem0]

validate_bd_design
save_bd_design
